# Altium schematic sheet 48V_Converter.SchDoc
size A; SheetNumber: 8; SheetTotal: 9
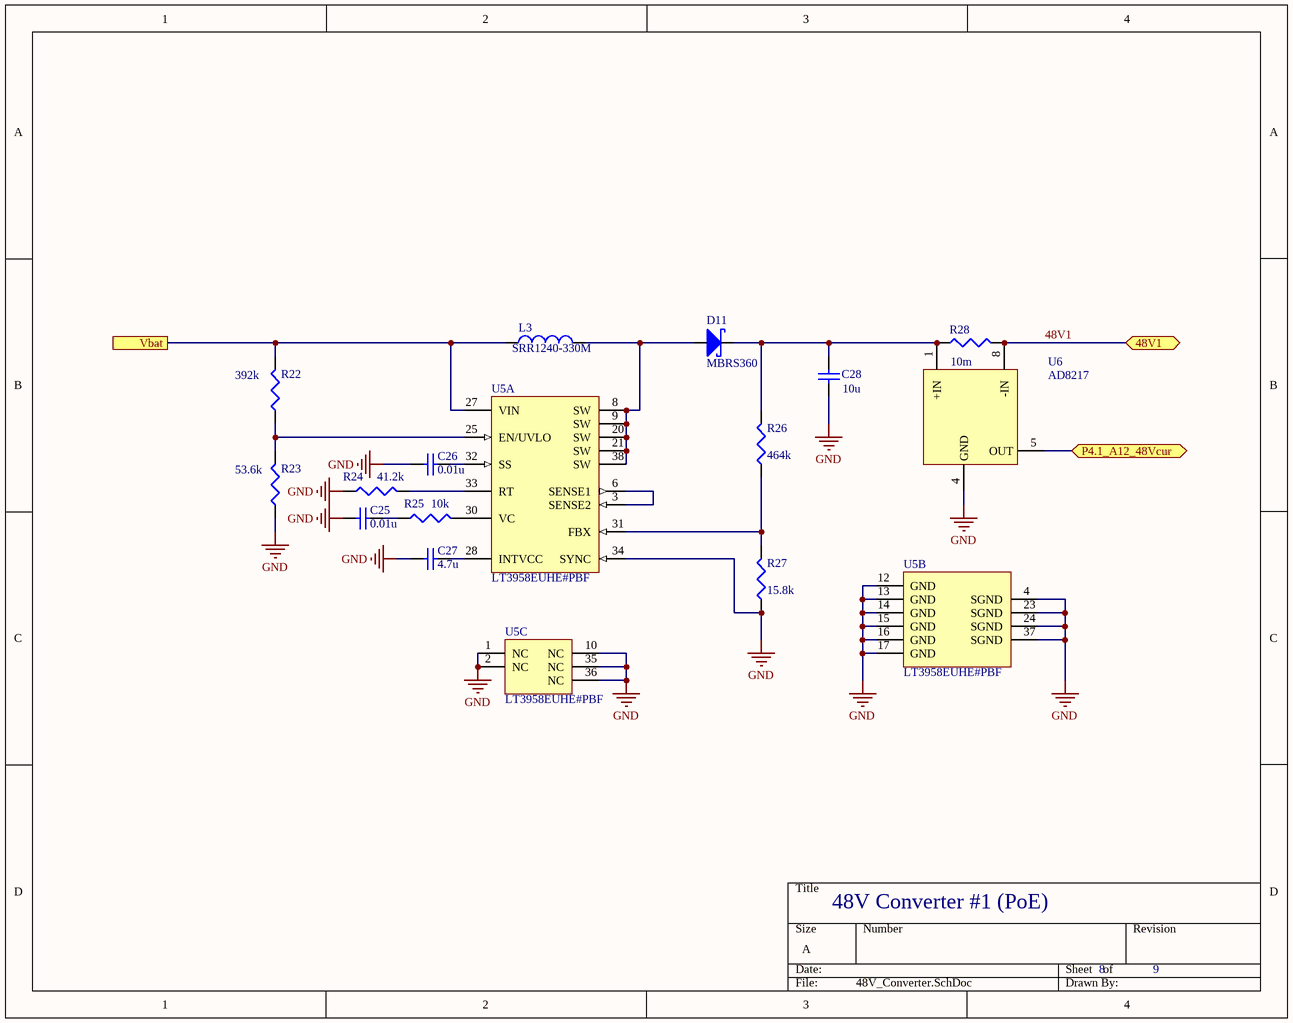
[diagram p0: 48V_Converter.SchDoc]

## Parts
C25  value 0.01u  [C1206]  (hidden comment: Cap Semi)
C26  value 0.01u  [C1206]  (hidden comment: Cap Semi)
C27  value 4.7u  [C1206]  (hidden comment: Cap Semi)
C28  value 10u  [C1206]  (hidden comment: Cap Semi)
D11  MBRS360  [MBRS360]
L3  SRR1240-330M  [SRR1240]
R22  value 392k  [J1-0603]  (hidden comment: Res3)
R23  value 53.6k  [J1-0603]  (hidden comment: Res3)
R24  value 41.2k  [J1-0603]  (hidden comment: Res3)
R25  value 10k  [J1-0603]  (hidden comment: Res3)
R26  value 464k  [J1-0603]  (hidden comment: Res3)
R27  value 15.8k  [J1-0603]  (hidden comment: Res3)
R28  value 10m  [J1-0603]  (hidden comment: Res3)
U5  LT3958EUHE#PBF  [LT-UHE-36-V-UHE28MA_V]  (parts A,B,C of 3)
U6  AD8217  [AD8217]

## Ports
48V1 (bidir), P4.1_A12_48Vcur (bidir), Vbat

## Nets
GND: C25.1 C26.1 C27.1 C28.1 R23.1 R24.1 R27.1 U5.1(NC) U5.2(NC) U5.4(SGND) U5.10(NC) U5.12(GND) U5.13(GND) U5.14(GND) U5.15(GND) U5.16(GND) U5.17(GND) U5.23(SGND) U5.24(SGND) U5.34(SYNC) U5.35(NC) U5.36(NC) U5.37(SGND) U6.4(GND)
48V1: R28.2 U6.8(-IN) ; port 48V1
P4.1_A12_48Vcur: U6.5(OUT) ; port P4.1_A12_48Vcur
Vbat: L3.1 R22.2 U5.27(VIN) ; port Vbat
NetC25_2: C25.2 R25.1
NetC26_2: C26.2 U5.32(SS)
NetC27_2: C27.2 U5.28(INTVCC)
NetC28_2: C28.2 D11.2(Cathode) R26.2 R28.1 U6.1(+IN)
NetD11_1: D11.1(Anode) L3.2 U5.8(SW) U5.9(SW) U5.20(SW) U5.21(SW) U5.38(SW)
NetR22_1: R22.1 R23.2 U5.25(EN/UVLO)
NetR24_2: R24.2 U5.33(RT)
NetR25_2: R25.2 U5.30(VC)
NetR26_1: R26.1 R27.2 U5.31(FBX)
NetU5_3: U5.3(SENSE2) U5.6(SENSE1)

## Notes on the sheet
- 48V Converter #1 (PoE)

## Library data of the parts
C25-C28 = Cap Semi: Capacitor (Semiconductor SIM Model); Published: 8-Jun-2000; LatestRevisionDate: 29-May-2009; LatestRevisionNote: IPC-7351 Footprint Added.; PackageReference: C1206; Publisher: Altium Limited; PackageDescription: Chip Capacitor
D11 = MBRS360: DIODE SCHOTTKY 60V 3A SMC; Digikey: https://www.digikey.com/product-detail/en/on-semiconductor/MBRS360T3G/MBRS360T3GOSCT-ND/918010; Datasheet: https://www.onsemi.com/pub/Collateral/MBRS360T3-D.PDF
L3 = SRR1240: FIXED IND 33UH 2.3A 97 MOHM SMD; Digikey: https://www.digikey.com/product-detail/en/bourns-inc/SRR1240-330M/SRR1240-330MCT-ND/2127395; Datasheet: https://www.bourns.com/docs/Product-Datasheets/SRR1240.pdf
R22-R28 = Res3: Resistor; Published: 8-Jun-2000; LatestRevisionDate: 29-May-2009; LatestRevisionNote: IPC-7351 Footprint Added.; PackageReference: J1-0603; Publisher: Altium Limited; PackageDescription: Chip Resistor
U5 = LT3958EUHE#PBF: High Input Voltage, Boost, Flyback, SEPIC and Inverting Converter, 36-pin QFN (UHE-36-UHE28MA), -40 to 125 degC, Pb-Free; Manufacturer: Linear Technology; Frequency Adjust Range: 100kHz - 1MHz; Number of Outputs: 1; PackageVersion: Rev. D, 02/2012; PackageReference: UHE-36; PackageDescription: 28-Pin Plastic QFN, Body 5 x 6 mm, Pitch 0.5 mm; Supplier 1: Digi-Key; Supplier Part Number 1: LT3958EUHE#PBF-ND; Supplier 2: Farnell; Supplier Part Number 2: 2294964; Supplier 3: Newark; Supplier Part Number 3: 78R8466; RoHS: TRUE; Mounting Technology: Surface Mount; PartNumber: LT3958EUHE#PBF; ComponentLink1Description: Manufacturer URL; ComponentLink1URL: http://www.linear.com/; ComponentLink2Description: Datasheet; ComponentLink2URL: http://cds.linear.com/docs/en/datasheet/3958f.pdf; ComponentLink3Description: Package Specification; ComponentLink3URL: http://cds.linear.com/docs/en/packaging/QFN_28_05-08-1836.pdf
U6 = AD8217: High Resolution, Zero-Drift  Current Shunt Monitor; Datasheet: https://www.analog.com/media/en/technical-documentation/data-sheets/AD8217.pdf